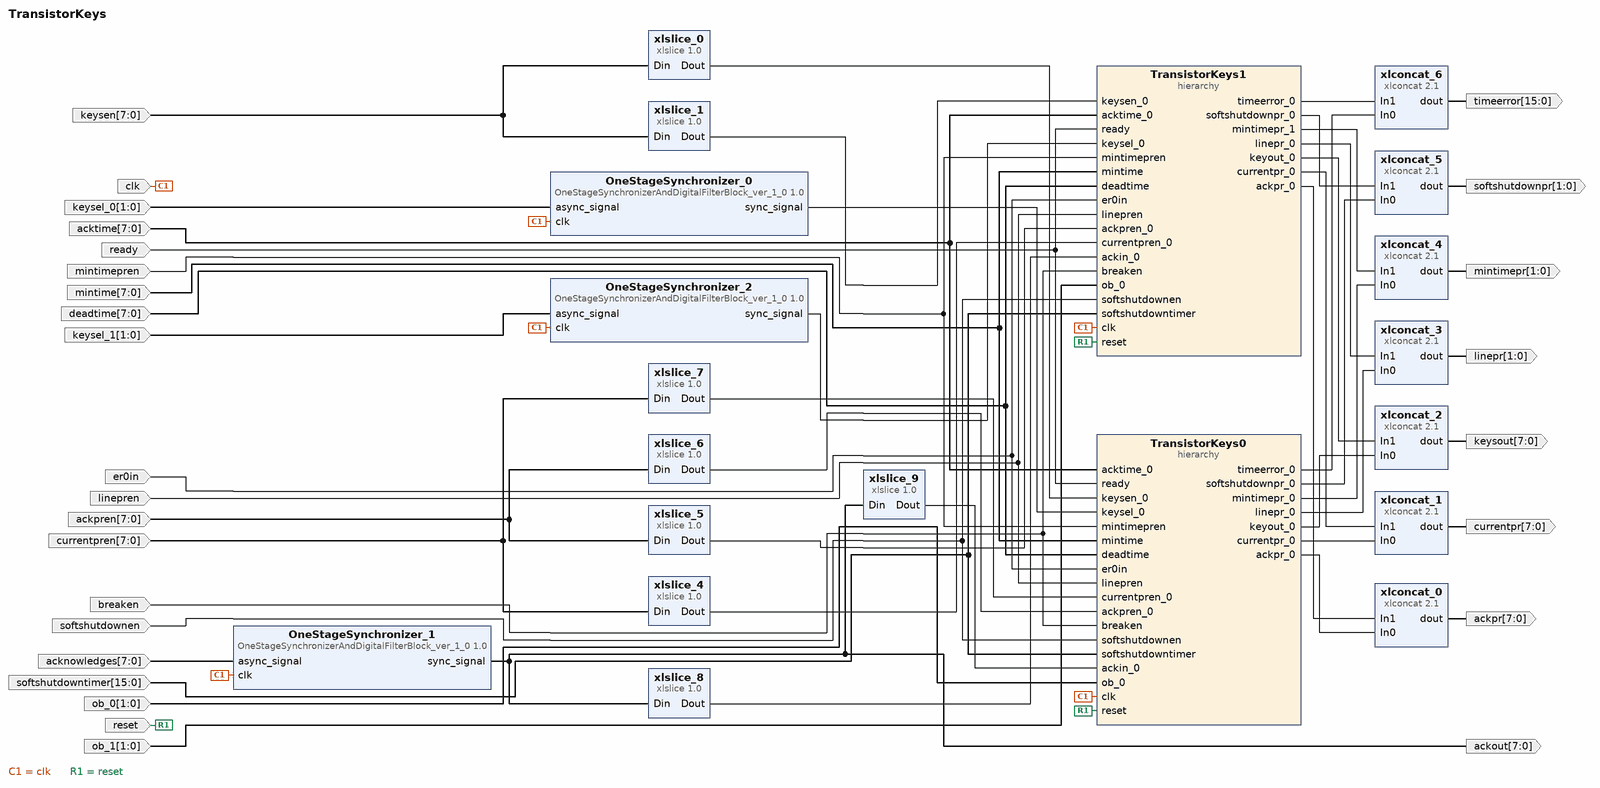
[diagram p0: block diagram of the top level]
# Vivado block design TransistorKeys, xc7z020clg484-3, Vivado 2019.1
create_bd_design TransistorKeys

create_bd_port -dir I -type clk clk
create_bd_port -dir I ready
create_bd_port -dir I -type rst reset
create_bd_port -dir I -from 7 -to 0 acktime
create_bd_port -dir I mintimepren
create_bd_port -dir I -from 7 -to 0 mintime
create_bd_port -dir I -from 7 -to 0 deadtime
create_bd_port -dir I er0in
create_bd_port -dir I linepren
create_bd_port -dir I breaken
create_bd_port -dir I softshutdownen
create_bd_port -dir O -from 7 -to 0 ackpr
create_bd_port -dir O -from 7 -to 0 currentpr
create_bd_port -dir I -from 7 -to 0 ackpren
create_bd_port -dir I -from 7 -to 0 currentpren
create_bd_port -dir I -from 15 -to 0 softshutdowntimer
create_bd_port -dir I -from 1 -to 0 ob_0
create_bd_port -dir I -from 1 -to 0 keysel_0
create_bd_port -dir I -from 1 -to 0 keysel_1
create_bd_port -dir I -from 1 -to 0 ob_1
create_bd_port -dir I -from 7 -to 0 acknowledges
create_bd_port -dir O -from 7 -to 0 keysout
create_bd_port -dir O -from 15 -to 0 timeerror
create_bd_port -dir I -from 7 -to 0 keysen
create_bd_port -dir O -from 1 -to 0 linepr
create_bd_port -dir O -from 1 -to 0 mintimepr
create_bd_port -dir O -from 1 -to 0 softshutdownpr
create_bd_port -dir O -from 7 -to 0 ackout

create_bd_cell -type hier TransistorKeys0
create_bd_cell -type hier TransistorKeys1
create_bd_cell -type ip -vlnv xilinx.com:ip:xlslice:1.0 xlslice_0
set_property -dict {CONFIG.DIN_FROM 3 CONFIG.DIN_TO 0 CONFIG.DIN_WIDTH 8 CONFIG.DOUT_WIDTH 4} [get_bd_cells xlslice_0]
create_bd_cell -type ip -vlnv xilinx.com:ip:xlslice:1.0 xlslice_1
set_property -dict {CONFIG.DIN_FROM 7 CONFIG.DIN_TO 4 CONFIG.DIN_WIDTH 8 CONFIG.DOUT_WIDTH 4} [get_bd_cells xlslice_1]
create_bd_cell -type ip -vlnv xilinx.com:ip:xlslice:1.0 xlslice_4
set_property -dict {CONFIG.DIN_FROM 7 CONFIG.DIN_TO 4 CONFIG.DIN_WIDTH 8 CONFIG.DOUT_WIDTH 4} [get_bd_cells xlslice_4]
create_bd_cell -type ip -vlnv xilinx.com:ip:xlslice:1.0 xlslice_5
set_property -dict {CONFIG.DIN_FROM 7 CONFIG.DIN_TO 4 CONFIG.DIN_WIDTH 8 CONFIG.DOUT_WIDTH 4} [get_bd_cells xlslice_5]
create_bd_cell -type ip -vlnv xilinx.com:ip:xlslice:1.0 xlslice_6
set_property -dict {CONFIG.DIN_FROM 3 CONFIG.DIN_TO 0 CONFIG.DIN_WIDTH 8 CONFIG.DOUT_WIDTH 4} [get_bd_cells xlslice_6]
create_bd_cell -type ip -vlnv xilinx.com:ip:xlslice:1.0 xlslice_7
set_property -dict {CONFIG.DIN_FROM 3 CONFIG.DIN_TO 0 CONFIG.DIN_WIDTH 8 CONFIG.DOUT_WIDTH 4} [get_bd_cells xlslice_7]
create_bd_cell -type ip -vlnv setcorp:user:OneStageSynchronizerAndDigitalFilterBlock_ver_1_0:1.0 OneStageSynchronizer_1
set_property -dict {CONFIG.PHASE_SHIFT 4 CONFIG.QUANTITY_CHANNELS 8} [get_bd_cells OneStageSynchronizer_1]
create_bd_cell -type ip -vlnv xilinx.com:ip:xlslice:1.0 xlslice_8
set_property -dict {CONFIG.DIN_FROM 7 CONFIG.DIN_TO 4 CONFIG.DIN_WIDTH 8 CONFIG.DOUT_WIDTH 4} [get_bd_cells xlslice_8]
create_bd_cell -type ip -vlnv xilinx.com:ip:xlslice:1.0 xlslice_9
set_property -dict {CONFIG.DIN_FROM 3 CONFIG.DIN_TO 0 CONFIG.DIN_WIDTH 8 CONFIG.DOUT_WIDTH 4} [get_bd_cells xlslice_9]
create_bd_cell -type ip -vlnv setcorp:user:OneStageSynchronizerAndDigitalFilterBlock_ver_1_0:1.0 OneStageSynchronizer_0
set_property -dict {CONFIG.PHASE_SHIFT 4 CONFIG.QUANTITY_CHANNELS 2} [get_bd_cells OneStageSynchronizer_0]
create_bd_cell -type ip -vlnv setcorp:user:OneStageSynchronizerAndDigitalFilterBlock_ver_1_0:1.0 OneStageSynchronizer_2
set_property -dict {CONFIG.PHASE_SHIFT 4 CONFIG.QUANTITY_CHANNELS 2} [get_bd_cells OneStageSynchronizer_2]
create_bd_cell -type ip -vlnv xilinx.com:ip:xlconcat:2.1 xlconcat_0
set_property -dict {CONFIG.IN0_WIDTH 4 CONFIG.IN1_WIDTH 4} [get_bd_cells xlconcat_0]
create_bd_cell -type ip -vlnv xilinx.com:ip:xlconcat:2.1 xlconcat_1
set_property -dict {CONFIG.IN0_WIDTH 4 CONFIG.IN1_WIDTH 4} [get_bd_cells xlconcat_1]
create_bd_cell -type ip -vlnv xilinx.com:ip:xlconcat:2.1 xlconcat_2
set_property -dict {CONFIG.IN0_WIDTH 4 CONFIG.IN1_WIDTH 4} [get_bd_cells xlconcat_2]
create_bd_cell -type ip -vlnv xilinx.com:ip:xlconcat:2.1 xlconcat_3
set_property -dict {CONFIG.IN0_WIDTH 1 CONFIG.IN1_WIDTH 1} [get_bd_cells xlconcat_3]
create_bd_cell -type ip -vlnv xilinx.com:ip:xlconcat:2.1 xlconcat_4
set_property -dict {CONFIG.IN0_WIDTH 1 CONFIG.IN1_WIDTH 1} [get_bd_cells xlconcat_4]
create_bd_cell -type ip -vlnv xilinx.com:ip:xlconcat:2.1 xlconcat_5
set_property -dict {CONFIG.IN0_WIDTH 1 CONFIG.IN1_WIDTH 1} [get_bd_cells xlconcat_5]
create_bd_cell -type ip -vlnv xilinx.com:ip:xlconcat:2.1 xlconcat_6
set_property -dict {CONFIG.IN0_WIDTH 8 CONFIG.IN1_WIDTH 8} [get_bd_cells xlconcat_6]

# ---- hierarchy /TransistorKeys0 ----
current_bd_instance /TransistorKeys0
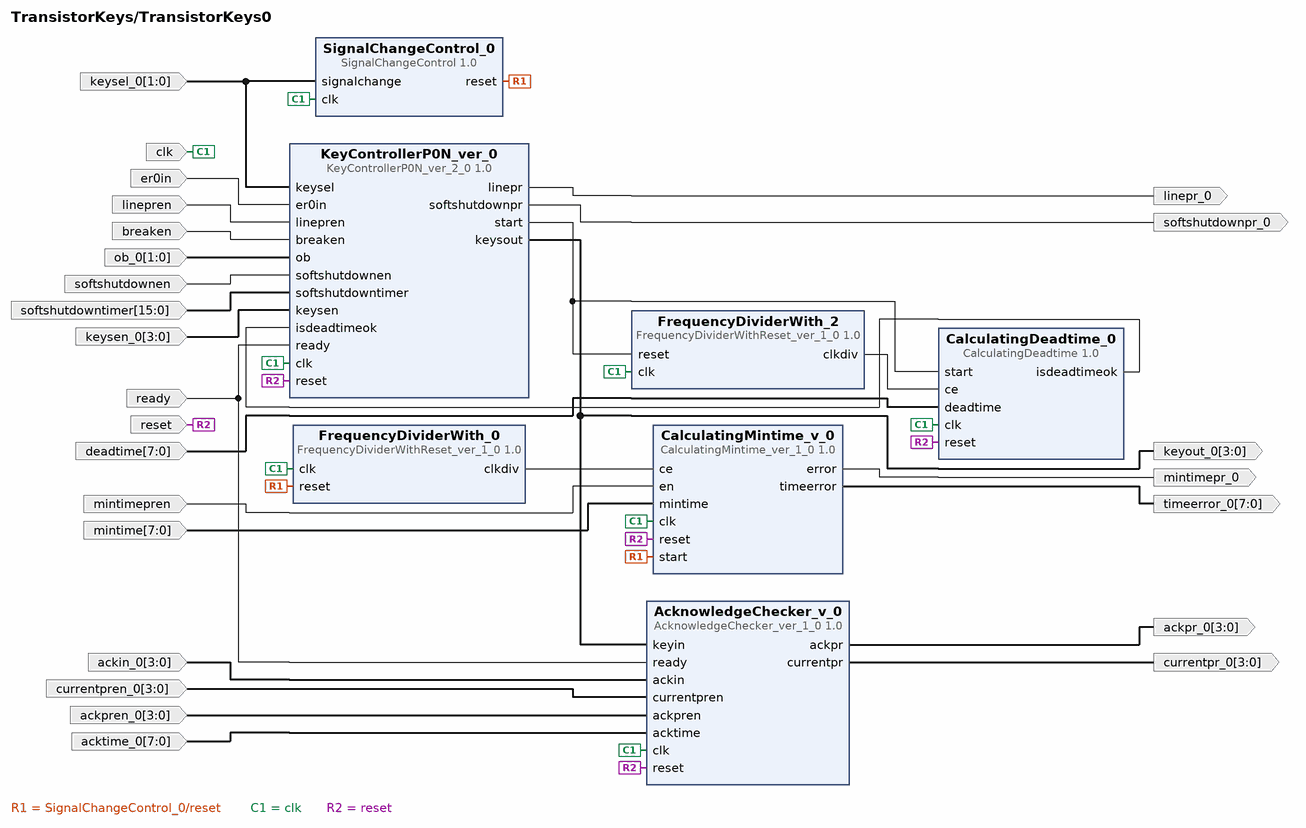
[diagram p1: block diagram inside /TransistorKeys0]
create_bd_pin -dir I -type clk clk
create_bd_pin -dir I -type rst reset
create_bd_pin -dir I -from 7 -to 0 deadtime
create_bd_pin -dir I er0in
create_bd_pin -dir I linepren
create_bd_pin -dir O linepr_0
create_bd_pin -dir O -from 3 -to 0 keyout_0
create_bd_pin -dir I -from 1 -to 0 keysel_0
create_bd_pin -dir I breaken
create_bd_pin -dir I ready
create_bd_pin -dir I -from 1 -to 0 ob_0
create_bd_pin -dir I softshutdownen
create_bd_pin -dir I -from 15 -to 0 softshutdowntimer
create_bd_pin -dir O softshutdownpr_0
create_bd_pin -dir I mintimepren
create_bd_pin -dir I -from 7 -to 0 mintime
create_bd_pin -dir O -from 7 -to 0 timeerror_0
create_bd_pin -dir O mintimepr_0
create_bd_pin -dir I -from 3 -to 0 ackin_0
create_bd_pin -dir I -from 3 -to 0 currentpren_0
create_bd_pin -dir I -from 3 -to 0 ackpren_0
create_bd_pin -dir O -from 3 -to 0 currentpr_0
create_bd_pin -dir O -from 3 -to 0 ackpr_0
create_bd_pin -dir I -from 7 -to 0 acktime_0
create_bd_pin -dir I -from 3 -to 0 keysen_0

create_bd_cell -type ip -vlnv setcorp:user:CalculatingDeadtime:1.0 CalculatingDeadtime_0
create_bd_cell -type ip -vlnv setcorp:user:FrequencyDividerWithReset_ver_1_0:1.0 FrequencyDividerWith_0
create_bd_cell -type ip -vlnv setcorp:user:FrequencyDividerWithReset_ver_1_0:1.0 FrequencyDividerWith_2
create_bd_cell -type ip -vlnv setcorp:user:CalculatingMintime_ver_1_0:1.0 CalculatingMintime_v_0
create_bd_cell -type ip -vlnv setcorp:user:AcknowledgeChecker_ver_1_0:1.0 AcknowledgeChecker_v_0
set_property -dict {CONFIG.QUANTITY_ACKNOWLEDGES 4} [get_bd_cells AcknowledgeChecker_v_0]
create_bd_cell -type ip -vlnv setcorp:user:SignalChangeControl:1.0 SignalChangeControl_0
create_bd_cell -type ip -vlnv setcorp:user:KeyControllerP0N_ver_2_0:1.0 KeyControllerP0N_ver_0

# ---- hierarchy /TransistorKeys1 ----
current_bd_instance /TransistorKeys1
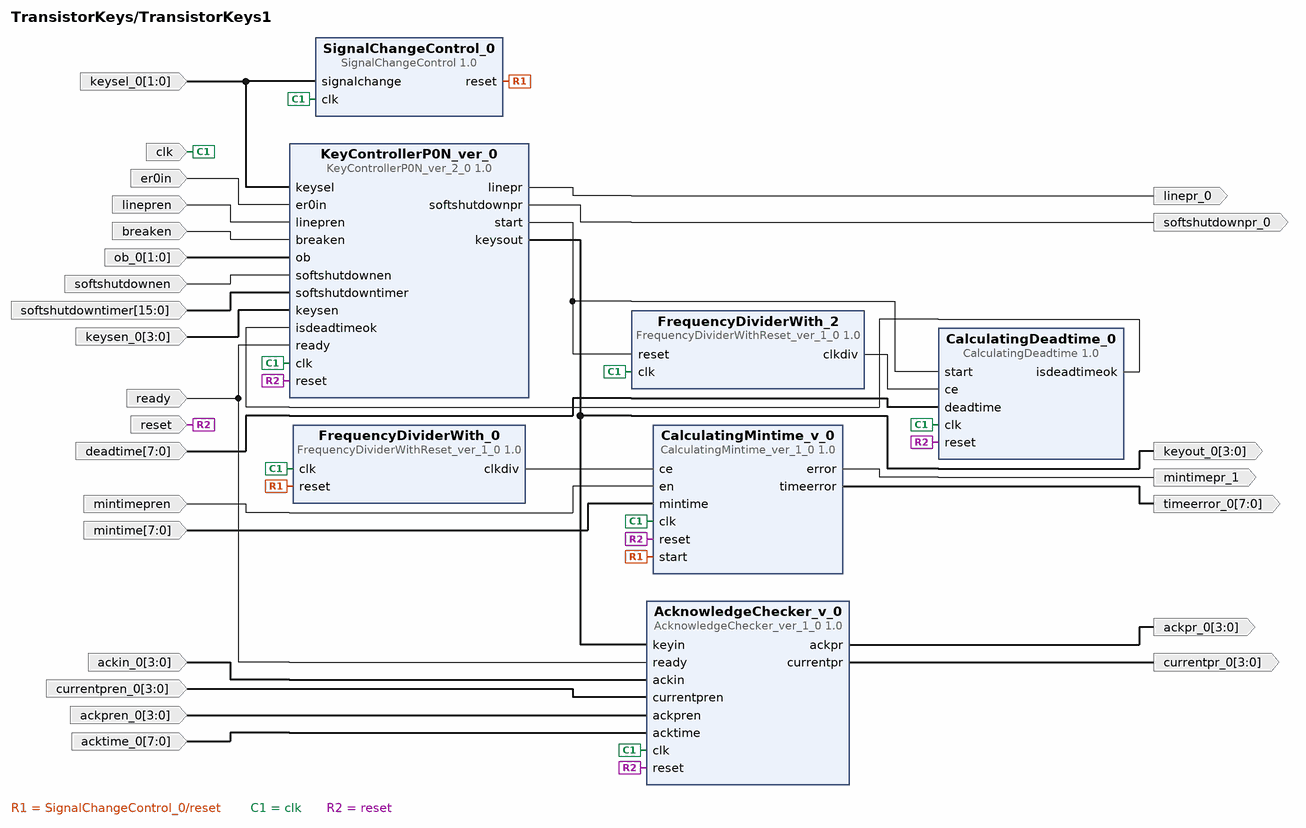
[diagram p2: block diagram inside /TransistorKeys1]
create_bd_pin -dir I -type clk clk
create_bd_pin -dir I -type rst reset
create_bd_pin -dir I -from 7 -to 0 deadtime
create_bd_pin -dir I er0in
create_bd_pin -dir I linepren
create_bd_pin -dir O linepr_0
create_bd_pin -dir O -from 3 -to 0 keyout_0
create_bd_pin -dir I -from 1 -to 0 keysel_0
create_bd_pin -dir I breaken
create_bd_pin -dir I ready
create_bd_pin -dir I -from 1 -to 0 ob_0
create_bd_pin -dir I softshutdownen
create_bd_pin -dir I -from 15 -to 0 softshutdowntimer
create_bd_pin -dir O softshutdownpr_0
create_bd_pin -dir I mintimepren
create_bd_pin -dir I -from 7 -to 0 mintime
create_bd_pin -dir O -from 7 -to 0 timeerror_0
create_bd_pin -dir O mintimepr_1
create_bd_pin -dir I -from 3 -to 0 ackin_0
create_bd_pin -dir I -from 3 -to 0 currentpren_0
create_bd_pin -dir I -from 3 -to 0 ackpren_0
create_bd_pin -dir O -from 3 -to 0 currentpr_0
create_bd_pin -dir O -from 3 -to 0 ackpr_0
create_bd_pin -dir I -from 7 -to 0 acktime_0
create_bd_pin -dir I -from 3 -to 0 keysen_0

create_bd_cell -type ip -vlnv setcorp:user:CalculatingDeadtime:1.0 CalculatingDeadtime_0
create_bd_cell -type ip -vlnv setcorp:user:FrequencyDividerWithReset_ver_1_0:1.0 FrequencyDividerWith_0
create_bd_cell -type ip -vlnv setcorp:user:FrequencyDividerWithReset_ver_1_0:1.0 FrequencyDividerWith_2
create_bd_cell -type ip -vlnv setcorp:user:CalculatingMintime_ver_1_0:1.0 CalculatingMintime_v_0
create_bd_cell -type ip -vlnv setcorp:user:AcknowledgeChecker_ver_1_0:1.0 AcknowledgeChecker_v_0
set_property -dict {CONFIG.QUANTITY_ACKNOWLEDGES 4} [get_bd_cells AcknowledgeChecker_v_0]
create_bd_cell -type ip -vlnv setcorp:user:SignalChangeControl:1.0 SignalChangeControl_0
create_bd_cell -type ip -vlnv setcorp:user:KeyControllerP0N_ver_2_0:1.0 KeyControllerP0N_ver_0

# ---- connections ----

current_bd_instance /TransistorKeys0
connect_bd_net [get_bd_pins FrequencyDividerWith_2/clkdiv] [get_bd_pins CalculatingDeadtime_0/ce]
connect_bd_net [get_bd_pins KeyControllerP0N_ver_0/start] [get_bd_pins FrequencyDividerWith_2/reset] [get_bd_pins CalculatingDeadtime_0/start]
connect_bd_net [get_bd_pins CalculatingDeadtime_0/isdeadtimeok] [get_bd_pins KeyControllerP0N_ver_0/isdeadtimeok]
connect_bd_net [get_bd_pins SignalChangeControl_0/reset] [get_bd_pins FrequencyDividerWith_0/reset] [get_bd_pins CalculatingMintime_v_0/start]
connect_bd_net [get_bd_pins FrequencyDividerWith_0/clkdiv] [get_bd_pins CalculatingMintime_v_0/ce]
connect_bd_net -net clk_0_1 [get_bd_pins clk] \
  [get_bd_pins AcknowledgeChecker_v_0/clk] [get_bd_pins SignalChangeControl_0/clk] [get_bd_pins FrequencyDividerWith_0/clk] \
  [get_bd_pins CalculatingMintime_v_0/clk] [get_bd_pins FrequencyDividerWith_2/clk] [get_bd_pins CalculatingDeadtime_0/clk] \
  [get_bd_pins KeyControllerP0N_ver_0/clk]
connect_bd_net [get_bd_pins reset] \
  [get_bd_pins AcknowledgeChecker_v_0/reset] [get_bd_pins CalculatingMintime_v_0/reset] \
  [get_bd_pins CalculatingDeadtime_0/reset] [get_bd_pins KeyControllerP0N_ver_0/reset]
connect_bd_net -net deadtime_0_1 [get_bd_pins deadtime] [get_bd_pins CalculatingDeadtime_0/deadtime]
connect_bd_net -net er0in_0_1 [get_bd_pins er0in] [get_bd_pins KeyControllerP0N_ver_0/er0in]
connect_bd_net -net linepren_0_1 [get_bd_pins linepren] [get_bd_pins KeyControllerP0N_ver_0/linepren]
connect_bd_net [get_bd_pins KeyControllerP0N_ver_0/linepr] [get_bd_pins linepr_0]
connect_bd_net -net KeyControllerP0N_ver_0_keyout [get_bd_pins KeyControllerP0N_ver_0/keysout] \
  [get_bd_pins keyout_0] [get_bd_pins AcknowledgeChecker_v_0/keyin]
connect_bd_net -net keysel_0_1 [get_bd_pins keysel_0] [get_bd_pins SignalChangeControl_0/signalchange] [get_bd_pins KeyControllerP0N_ver_0/keysel]
connect_bd_net -net breaken_0_1 [get_bd_pins breaken] [get_bd_pins KeyControllerP0N_ver_0/breaken]
connect_bd_net [get_bd_pins ready] [get_bd_pins AcknowledgeChecker_v_0/ready] [get_bd_pins KeyControllerP0N_ver_0/ready]
connect_bd_net -net ob_0_1 [get_bd_pins ob_0] [get_bd_pins KeyControllerP0N_ver_0/ob]
connect_bd_net -net softshutdownen_0_1 [get_bd_pins softshutdownen] [get_bd_pins KeyControllerP0N_ver_0/softshutdownen]
connect_bd_net -net softshutdowntimer_0_1 [get_bd_pins softshutdowntimer] [get_bd_pins KeyControllerP0N_ver_0/softshutdowntimer]
connect_bd_net [get_bd_pins KeyControllerP0N_ver_0/softshutdownpr] [get_bd_pins softshutdownpr_0]
connect_bd_net -net en_0_1 [get_bd_pins mintimepren] [get_bd_pins CalculatingMintime_v_0/en]
connect_bd_net -net mintime_0_1 [get_bd_pins mintime] [get_bd_pins CalculatingMintime_v_0/mintime]
connect_bd_net [get_bd_pins CalculatingMintime_v_0/timeerror] [get_bd_pins timeerror_0]
connect_bd_net [get_bd_pins CalculatingMintime_v_0/error] [get_bd_pins mintimepr_0]
connect_bd_net -net ackin_0_1 [get_bd_pins ackin_0] [get_bd_pins AcknowledgeChecker_v_0/ackin]
connect_bd_net -net currentpren_0_1 [get_bd_pins currentpren_0] [get_bd_pins AcknowledgeChecker_v_0/currentpren]
connect_bd_net -net ackpren_0_1 [get_bd_pins ackpren_0] [get_bd_pins AcknowledgeChecker_v_0/ackpren]
connect_bd_net [get_bd_pins AcknowledgeChecker_v_0/currentpr] [get_bd_pins currentpr_0]
connect_bd_net [get_bd_pins AcknowledgeChecker_v_0/ackpr] [get_bd_pins ackpr_0]
connect_bd_net -net acktime_0_1 [get_bd_pins acktime_0] [get_bd_pins AcknowledgeChecker_v_0/acktime]
connect_bd_net -net keysen_1_1 [get_bd_pins keysen_0] [get_bd_pins KeyControllerP0N_ver_0/keysen]

current_bd_instance /TransistorKeys1
connect_bd_net [get_bd_pins FrequencyDividerWith_2/clkdiv] [get_bd_pins CalculatingDeadtime_0/ce]
connect_bd_net [get_bd_pins KeyControllerP0N_ver_0/start] [get_bd_pins FrequencyDividerWith_2/reset] [get_bd_pins CalculatingDeadtime_0/start]
connect_bd_net [get_bd_pins CalculatingDeadtime_0/isdeadtimeok] [get_bd_pins KeyControllerP0N_ver_0/isdeadtimeok]
connect_bd_net [get_bd_pins SignalChangeControl_0/reset] [get_bd_pins FrequencyDividerWith_0/reset] [get_bd_pins CalculatingMintime_v_0/start]
connect_bd_net [get_bd_pins FrequencyDividerWith_0/clkdiv] [get_bd_pins CalculatingMintime_v_0/ce]
connect_bd_net -net clk_0_1 [get_bd_pins clk] \
  [get_bd_pins AcknowledgeChecker_v_0/clk] [get_bd_pins SignalChangeControl_0/clk] [get_bd_pins FrequencyDividerWith_0/clk] \
  [get_bd_pins CalculatingMintime_v_0/clk] [get_bd_pins FrequencyDividerWith_2/clk] [get_bd_pins CalculatingDeadtime_0/clk] \
  [get_bd_pins KeyControllerP0N_ver_0/clk]
connect_bd_net [get_bd_pins reset] \
  [get_bd_pins AcknowledgeChecker_v_0/reset] [get_bd_pins CalculatingMintime_v_0/reset] \
  [get_bd_pins CalculatingDeadtime_0/reset] [get_bd_pins KeyControllerP0N_ver_0/reset]
connect_bd_net -net deadtime_0_1 [get_bd_pins deadtime] [get_bd_pins CalculatingDeadtime_0/deadtime]
connect_bd_net -net er0in_0_1 [get_bd_pins er0in] [get_bd_pins KeyControllerP0N_ver_0/er0in]
connect_bd_net -net linepren_0_1 [get_bd_pins linepren] [get_bd_pins KeyControllerP0N_ver_0/linepren]
connect_bd_net [get_bd_pins KeyControllerP0N_ver_0/linepr] [get_bd_pins linepr_0]
connect_bd_net -net KeyControllerP0N_ver_0_keyout [get_bd_pins KeyControllerP0N_ver_0/keysout] \
  [get_bd_pins keyout_0] [get_bd_pins AcknowledgeChecker_v_0/keyin]
connect_bd_net -net keysel_0_1 [get_bd_pins keysel_0] [get_bd_pins SignalChangeControl_0/signalchange] [get_bd_pins KeyControllerP0N_ver_0/keysel]
connect_bd_net -net breaken_0_1 [get_bd_pins breaken] [get_bd_pins KeyControllerP0N_ver_0/breaken]
connect_bd_net [get_bd_pins ready] [get_bd_pins AcknowledgeChecker_v_0/ready] [get_bd_pins KeyControllerP0N_ver_0/ready]
connect_bd_net -net ob_0_1 [get_bd_pins ob_0] [get_bd_pins KeyControllerP0N_ver_0/ob]
connect_bd_net -net softshutdownen_0_1 [get_bd_pins softshutdownen] [get_bd_pins KeyControllerP0N_ver_0/softshutdownen]
connect_bd_net -net softshutdowntimer_0_1 [get_bd_pins softshutdowntimer] [get_bd_pins KeyControllerP0N_ver_0/softshutdowntimer]
connect_bd_net [get_bd_pins KeyControllerP0N_ver_0/softshutdownpr] [get_bd_pins softshutdownpr_0]
connect_bd_net -net en_0_1 [get_bd_pins mintimepren] [get_bd_pins CalculatingMintime_v_0/en]
connect_bd_net -net mintime_0_1 [get_bd_pins mintime] [get_bd_pins CalculatingMintime_v_0/mintime]
connect_bd_net [get_bd_pins CalculatingMintime_v_0/timeerror] [get_bd_pins timeerror_0]
connect_bd_net [get_bd_pins CalculatingMintime_v_0/error] [get_bd_pins mintimepr_1]
connect_bd_net -net ackin_0_1 [get_bd_pins ackin_0] [get_bd_pins AcknowledgeChecker_v_0/ackin]
connect_bd_net -net currentpren_0_1 [get_bd_pins currentpren_0] [get_bd_pins AcknowledgeChecker_v_0/currentpren]
connect_bd_net -net ackpren_0_1 [get_bd_pins ackpren_0] [get_bd_pins AcknowledgeChecker_v_0/ackpren]
connect_bd_net [get_bd_pins AcknowledgeChecker_v_0/currentpr] [get_bd_pins currentpr_0]
connect_bd_net [get_bd_pins AcknowledgeChecker_v_0/ackpr] [get_bd_pins ackpr_0]
connect_bd_net -net acktime_0_1 [get_bd_pins acktime_0] [get_bd_pins AcknowledgeChecker_v_0/acktime]
connect_bd_net -net keysen_0_1 [get_bd_pins keysen_0] [get_bd_pins KeyControllerP0N_ver_0/keysen]

current_bd_instance /
connect_bd_net -net clk_0_1 [get_bd_ports clk] \
  [get_bd_pins TransistorKeys0/clk] [get_bd_pins TransistorKeys1/clk] [get_bd_pins OneStageSynchronizer_1/clk] \
  [get_bd_pins OneStageSynchronizer_0/clk] [get_bd_pins OneStageSynchronizer_2/clk]
connect_bd_net -net acktime_0_1 [get_bd_ports acktime] [get_bd_pins TransistorKeys0/acktime_0] [get_bd_pins TransistorKeys1/acktime_0]
connect_bd_net [get_bd_ports ready] [get_bd_pins TransistorKeys0/ready] [get_bd_pins TransistorKeys1/ready]
connect_bd_net [get_bd_ports reset] [get_bd_pins TransistorKeys0/reset] [get_bd_pins TransistorKeys1/reset]
connect_bd_net -net en_0_1 [get_bd_ports mintimepren] [get_bd_pins TransistorKeys0/mintimepren] [get_bd_pins TransistorKeys1/mintimepren]
connect_bd_net -net mintime_0_1 [get_bd_ports mintime] [get_bd_pins TransistorKeys0/mintime] [get_bd_pins TransistorKeys1/mintime]
connect_bd_net -net deadtime_0_1 [get_bd_ports deadtime] [get_bd_pins TransistorKeys0/deadtime] [get_bd_pins TransistorKeys1/deadtime]
connect_bd_net -net er0in_0_1 [get_bd_ports er0in] [get_bd_pins TransistorKeys0/er0in] [get_bd_pins TransistorKeys1/er0in]
connect_bd_net -net linepren_0_1 [get_bd_ports linepren] [get_bd_pins TransistorKeys0/linepren] [get_bd_pins TransistorKeys1/linepren]
connect_bd_net -net breaken_0_1 [get_bd_ports breaken] [get_bd_pins TransistorKeys0/breaken] [get_bd_pins TransistorKeys1/breaken]
connect_bd_net -net softshutdownen_0_1 [get_bd_ports softshutdownen] \
  [get_bd_pins TransistorKeys0/softshutdownen] [get_bd_pins TransistorKeys1/softshutdownen]
connect_bd_net -net softshutdowntimer_0_1 [get_bd_ports softshutdowntimer] \
  [get_bd_pins TransistorKeys0/softshutdowntimer] [get_bd_pins TransistorKeys1/softshutdowntimer]
connect_bd_net -net ob_0_1 [get_bd_ports ob_0] [get_bd_pins TransistorKeys0/ob_0]
connect_bd_net -net ob_0_0_1 [get_bd_ports ob_1] [get_bd_pins TransistorKeys1/ob_0]
connect_bd_net -net keysen_0_2 [get_bd_pins xlslice_0/Dout] [get_bd_pins TransistorKeys0/keysen_0]
connect_bd_net [get_bd_ports keysen] [get_bd_pins xlslice_0/Din] [get_bd_pins xlslice_1/Din]
connect_bd_net [get_bd_pins xlslice_1/Dout] [get_bd_pins TransistorKeys1/keysen_0]
connect_bd_net [get_bd_pins xlslice_4/Dout] [get_bd_pins TransistorKeys1/currentpren_0]
connect_bd_net [get_bd_pins xlslice_5/Dout] [get_bd_pins TransistorKeys1/ackpren_0]
connect_bd_net [get_bd_pins xlslice_6/Dout] [get_bd_pins TransistorKeys0/ackpren_0]
connect_bd_net [get_bd_pins xlslice_7/Dout] [get_bd_pins TransistorKeys0/currentpren_0]
connect_bd_net [get_bd_ports ackpren] [get_bd_pins xlslice_6/Din] [get_bd_pins xlslice_5/Din]
connect_bd_net [get_bd_ports currentpren] [get_bd_pins xlslice_7/Din] [get_bd_pins xlslice_4/Din]
connect_bd_net [get_bd_pins xlslice_8/Dout] [get_bd_pins TransistorKeys1/ackin_0]
connect_bd_net [get_bd_pins xlslice_9/Dout] [get_bd_pins TransistorKeys0/ackin_0]
connect_bd_net -net keysel_0_1 [get_bd_ports keysel_0] [get_bd_pins OneStageSynchronizer_0/async_signal]
connect_bd_net -net keysel_0_2 [get_bd_pins OneStageSynchronizer_0/sync_signal] [get_bd_pins TransistorKeys0/keysel_0]
connect_bd_net -net keysel_0_3 [get_bd_pins OneStageSynchronizer_2/sync_signal] [get_bd_pins TransistorKeys1/keysel_0]
connect_bd_net -net keysel_1_1 [get_bd_ports keysel_1] [get_bd_pins OneStageSynchronizer_2/async_signal]
connect_bd_net [get_bd_pins xlconcat_0/dout] [get_bd_ports ackpr]
connect_bd_net [get_bd_pins TransistorKeys0/ackpr_0] [get_bd_pins xlconcat_0/In0]
connect_bd_net [get_bd_pins TransistorKeys1/ackpr_0] [get_bd_pins xlconcat_0/In1]
connect_bd_net [get_bd_pins xlconcat_1/dout] [get_bd_ports currentpr]
connect_bd_net [get_bd_pins TransistorKeys0/currentpr_0] [get_bd_pins xlconcat_1/In0]
connect_bd_net [get_bd_pins TransistorKeys1/currentpr_0] [get_bd_pins xlconcat_1/In1]
connect_bd_net [get_bd_pins xlconcat_2/dout] [get_bd_ports keysout]
connect_bd_net [get_bd_pins TransistorKeys0/keyout_0] [get_bd_pins xlconcat_2/In0]
connect_bd_net [get_bd_pins TransistorKeys1/keyout_0] [get_bd_pins xlconcat_2/In1]
connect_bd_net [get_bd_pins TransistorKeys1/linepr_0] [get_bd_pins xlconcat_3/In1]
connect_bd_net [get_bd_pins TransistorKeys0/linepr_0] [get_bd_pins xlconcat_3/In0]
connect_bd_net [get_bd_pins xlconcat_3/dout] [get_bd_ports linepr]
connect_bd_net -net xlconcat_3_dout1 [get_bd_pins xlconcat_4/dout] [get_bd_ports mintimepr]
connect_bd_net [get_bd_pins TransistorKeys0/mintimepr_0] [get_bd_pins xlconcat_4/In0]
connect_bd_net [get_bd_pins TransistorKeys1/mintimepr_1] [get_bd_pins xlconcat_4/In1]
connect_bd_net [get_bd_pins xlconcat_5/dout] [get_bd_ports softshutdownpr]
connect_bd_net [get_bd_pins TransistorKeys1/softshutdownpr_0] [get_bd_pins xlconcat_5/In1]
connect_bd_net [get_bd_pins TransistorKeys0/softshutdownpr_0] [get_bd_pins xlconcat_5/In0]
connect_bd_net [get_bd_pins TransistorKeys0/timeerror_0] [get_bd_pins xlconcat_6/In0]
connect_bd_net [get_bd_pins TransistorKeys1/timeerror_0] [get_bd_pins xlconcat_6/In1]
connect_bd_net [get_bd_pins xlconcat_6/dout] [get_bd_ports timeerror]
connect_bd_net [get_bd_pins OneStageSynchronizer_1/sync_signal] [get_bd_ports ackout] [get_bd_pins xlslice_8/Din] [get_bd_pins xlslice_9/Din]
connect_bd_net [get_bd_ports acknowledges] [get_bd_pins OneStageSynchronizer_1/async_signal]

validate_bd_design
save_bd_design
